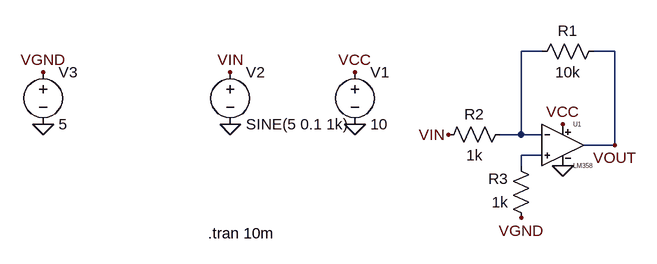
[diagram p0: schematic lm358.asc]
lm358.asc, the LTspice schematic file:
Version 4
SHEET 1 880 680
WIRE 192 -240 160 -240
WIRE 304 -240 272 -240
WIRE 160 -112 160 -240
WIRE 160 -112 128 -112
WIRE 192 -112 160 -112
WIRE 304 -96 304 -240
WIRE 304 -96 256 -96
WIRE 192 -80 160 -80
WIRE 160 -64 160 -80
FLAG -96 -208 VCC
FLAG -96 -128 0
FLAG 224 -128 VCC
FLAG 224 -64 0
FLAG 304 -96 VOUT
FLAG 48 -112 VIN
FLAG -288 -208 VIN
FLAG -288 -128 0
FLAG -576 -208 VGND
FLAG -576 -128 0
FLAG 160 16 VGND
SYMBOL LM358 224 -160 R0
SYMATTR InstName U1
SYMBOL voltage -96 -224 R0
WINDOW 123 0 0 Left 0
WINDOW 39 0 0 Left 0
SYMATTR InstName V1
SYMATTR Value 10
SYMBOL res 288 -256 R90
WINDOW 0 0 56 VBottom 2
WINDOW 3 32 56 VTop 2
SYMATTR InstName R1
SYMATTR Value 10k
SYMBOL res 144 -128 R90
WINDOW 0 0 56 VBottom 2
WINDOW 3 32 56 VTop 2
SYMATTR InstName R2
SYMATTR Value 1k
SYMBOL res 176 32 R180
WINDOW 0 36 76 Left 2
WINDOW 3 36 40 Left 2
SYMATTR InstName R3
SYMATTR Value 1k
SYMBOL voltage -288 -224 R0
WINDOW 123 0 0 Left 0
WINDOW 39 0 0 Left 0
SYMATTR InstName V2
SYMATTR Value SINE(5 0.1 1k)
SYMBOL voltage -576 -224 R0
WINDOW 123 0 0 Left 0
WINDOW 39 0 0 Left 0
SYMATTR InstName V3
SYMATTR Value 5
TEXT -322 40 Left 2 !.tran 10m

The netlist it stands for:
* lm358.asc
XU1 N002 N001 VCC 0 VOUT LMX58_LM2904  ; pins IN+ IN- VCC VEE OUT
V1 VCC 0 10
R1 VOUT N001 10k
R2 N001 VIN 1k
R3 VGND N002 1k
V2 VIN 0 SINE(5 0.1 1k)
V3 VGND 0 5
.tran 10m
.lib LMx58_LM2904.lib
.backanno
.end